# Altium project MD045B.PrjPcb (part 2 of 2)

## Sheet MD045B_POWER_AND_CONNECTORS.SchDoc: DRV8311HEVM
size 431 x 279 mm; Date: Not shown in title block; ApprovedBy: Not shown in title block; CheckedBy: Not shown in title block; Author: Not shown in title block; CompanyName: Not shown in title block; Engineer: Not shown in title block; Organization: Not shown in title block; Address1: Not shown in title block; Address2: Not shown in title block; Address3: Not shown in title block; Address4: Not shown in title block; DocumentNumber: 2; Revision: Use project parameter SCH_Rev; SheetNumber: 2; SheetTotal: 3; PageSetup: Record=PageOptions|CenterHorizontal=True|CenterVertical=True|PrintScale=1.00|XCorrection=1.00|YCorrection=1.00|PrintKind=0|BorderSize=5000000|LeftOffset=0|BottomOffset=0|Orientation=2|PaperLength=1000|PaperWidth=1000|Scale=100|PaperSource=15|PrintQuality=600|MediaType=1|DitherType=10|PaperKind=Letter|PrintScaleMode=1; CurrentTime: Not shown in title block; CurrentDate: Not shown in title block; Time: Not shown in title block; DocumentFullPathAndName: Not shown in title block; DocumentName: Not shown in title block; ModifiedDate: Not shown in title block; ImagePath: Not shown in title block
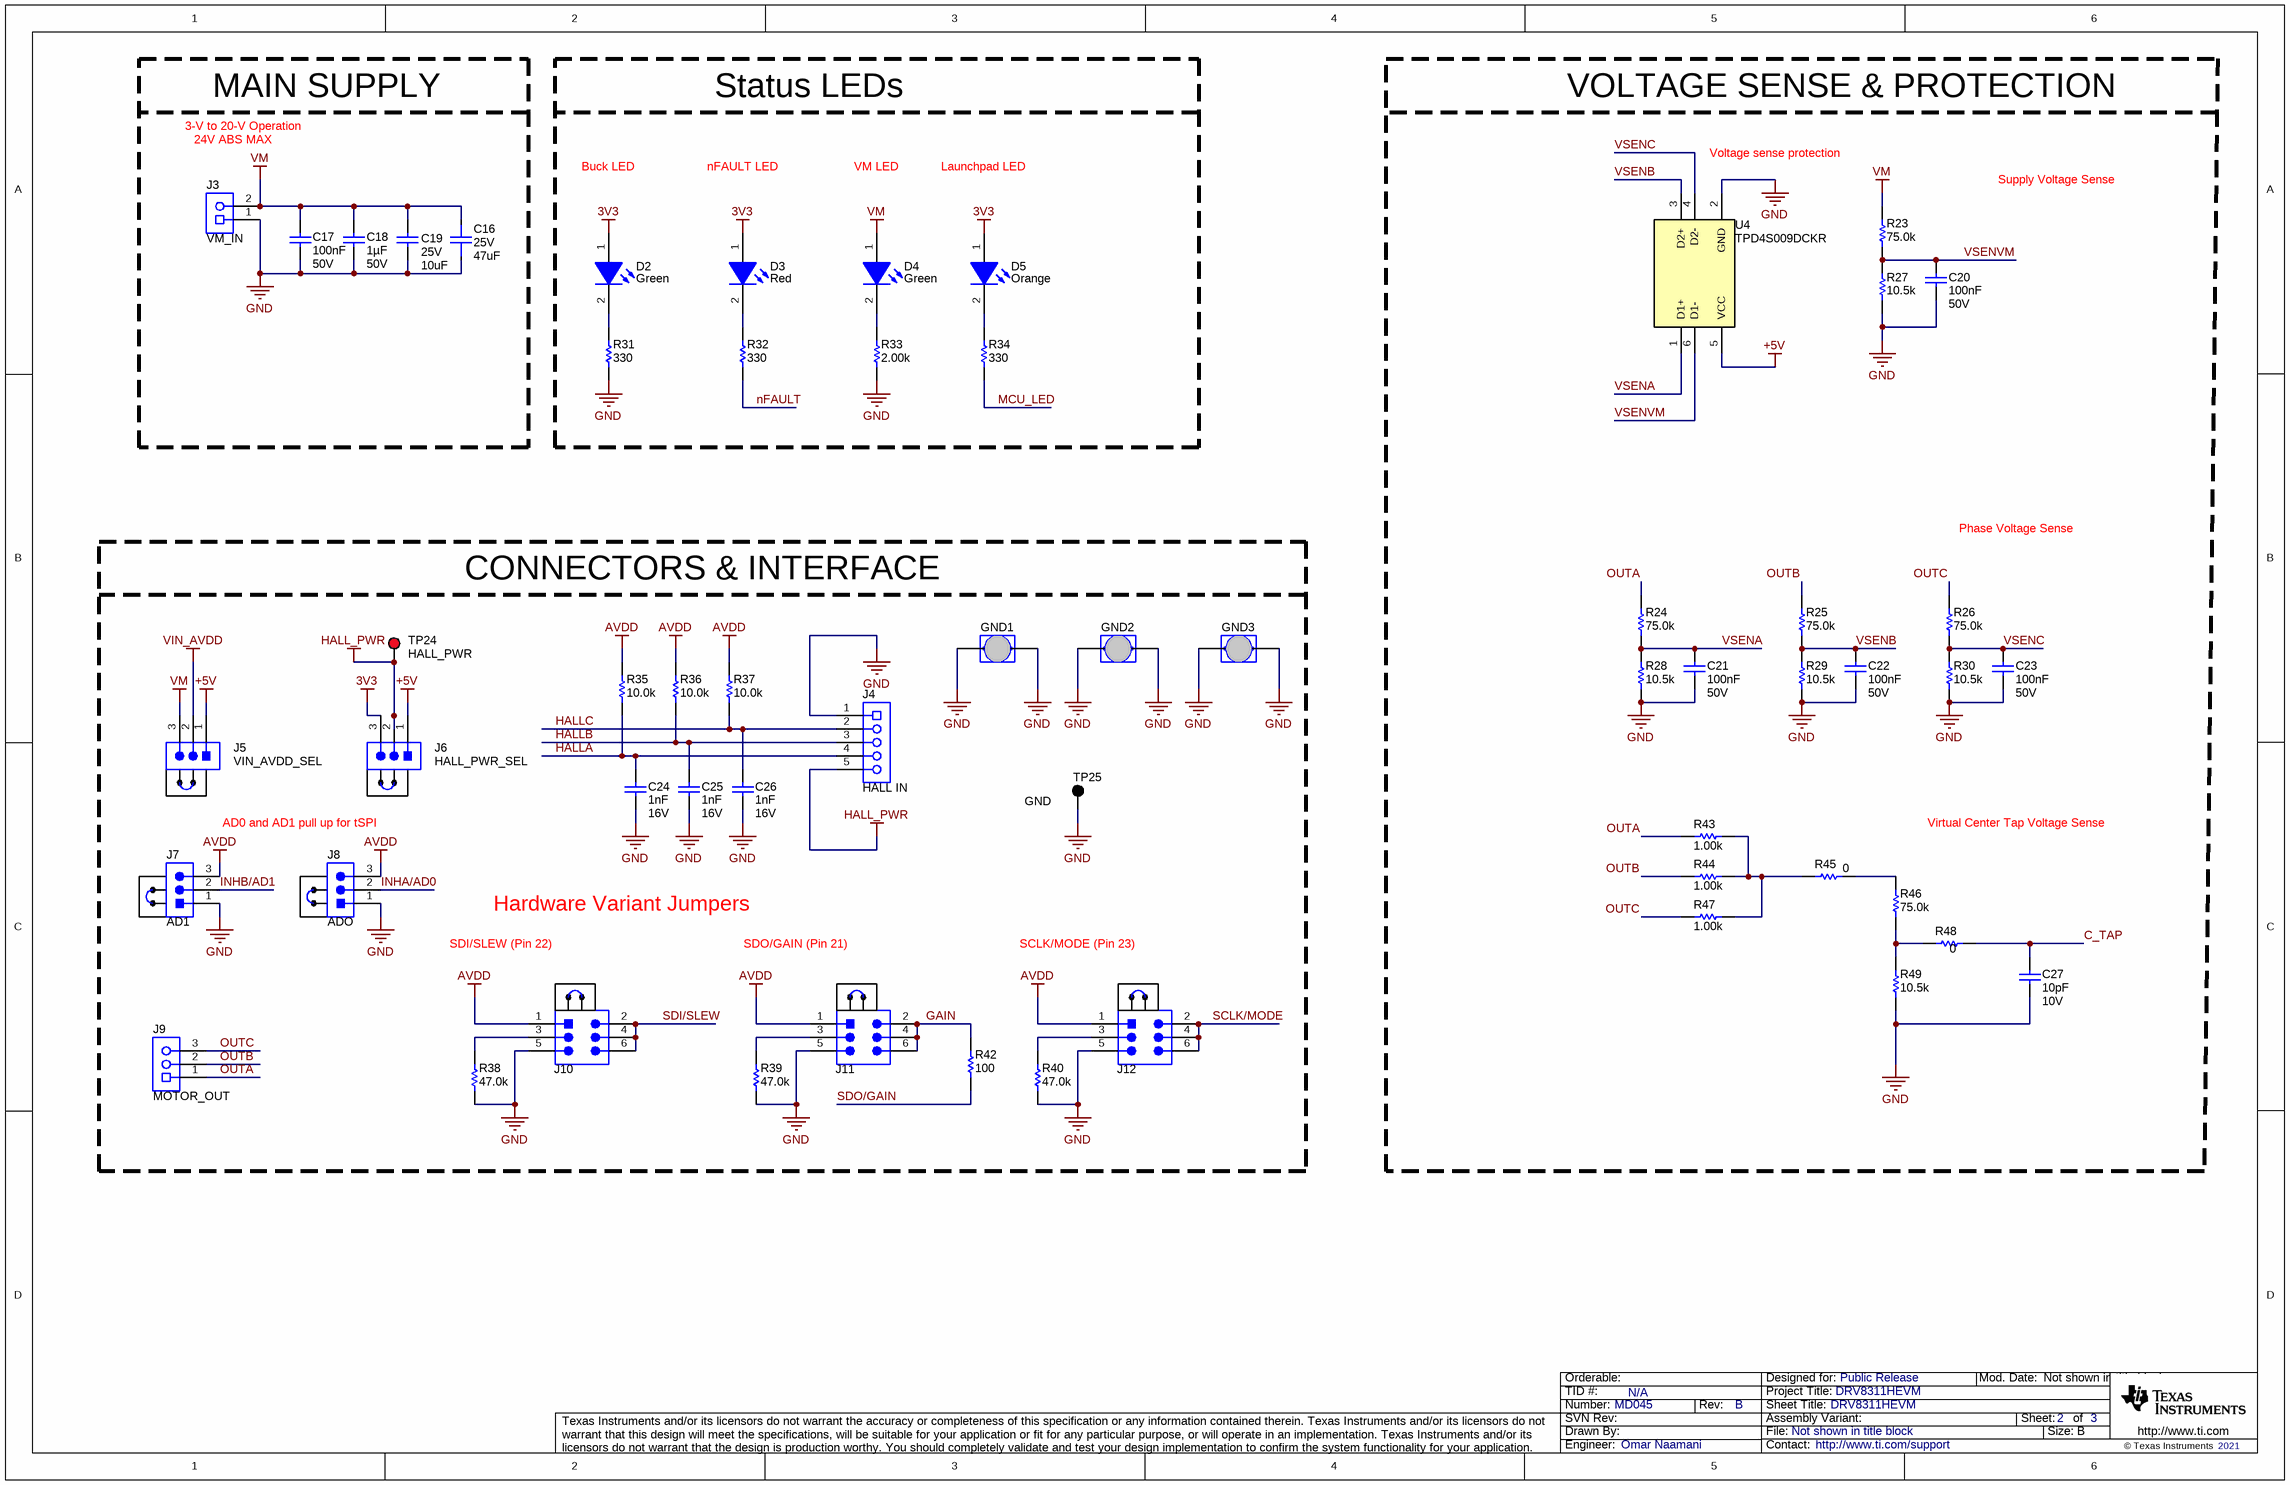
[diagram p2: MD045B_POWER_AND_CONNECTORS.SchDoc]

### Parts
C16  VDC_V: 25V  ValueDisplayed: 47uF  [FP-GRM31CR61E476ME44L_1206-MFG]  (hidden comment: GRM31CR61E476ME44L)
C17  Cap_F: 100nF  VDC_V: 50V  [0805L]  (hidden comment: C0805C104K5RACAUTO)
C18  Cap_F: 1µF  VDC_V: 50V  [0805L]  (hidden comment: 885012207103)
C19  VDC_V: 25V  ValueDisplayed: 10uF  [0805L]  (hidden comment: GRM21BC71E106KE11L)
C20  Cap_F: 100nF  VDC_V: 50V  [0603L]  (hidden comment: 06035C104JAT2A)
C21  Cap_F: 100nF  VDC_V: 50V  [0603L]  (hidden comment: 06035C104JAT2A)
C22  Cap_F: 100nF  VDC_V: 50V  [0603L]  (hidden comment: 06035C104JAT2A)
C23  Cap_F: 100nF  VDC_V: 50V  [0603L]  (hidden comment: 06035C104JAT2A)
C24  Cap_F: 1nF  VDC_V: 16V  [0603L]  (hidden comment: 885012206034)
C25  Cap_F: 1nF  VDC_V: 16V  [0603L]  (hidden comment: 885012206034)
C26  Cap_F: 1nF  VDC_V: 16V  [0603L]  (hidden comment: 885012206034)
C27  Cap_F: 10pF  VDC_V: 10V  [0603L]  (hidden comment: 0603ZC100KAT2A)
D2  value Green  [LTST-C170KGKT_Green]  (hidden comment: LTST-C170KGKT)
D3  value Red  [LED_LTST-C170_Red]  (hidden comment: LTST-C170KRKT)
D4  value Green  [LTST-C170KGKT_Green]  (hidden comment: LTST-C170KGKT)
D5  value Orange  [LTST-C170KFKT_Orange]  (hidden comment: LTST-C170KFKT)
GND1  GND  [Harwin_D3082-05]  (value not drawn)
GND2  GND  [Harwin_D3082-05]  (value not drawn)
GND3  GND  [Harwin_D3082-05]  (value not drawn)
J3  VM_IN  [On-Shore_ED120_2DS]
J4  HALL IN  [Phoenix_1792892]
J5  VIN_AVDD_SEL  [FCI_68001-403HLF]
J6  HALL_PWR_SEL  [FCI_68001-403HLF]
J7  AD1  [FCI_68001-403HLF]
J8  ADO  [FCI_68001-403HLF]
J9  MOTOR_OUT  [On-Shore_ED120_3DS]
J10  Header_3x2  [TSW-103-07-G-D]  (value not drawn)
J11  Header_3x2  [TSW-103-07-G-D]  (value not drawn)
J12  Header_3x2  [TSW-103-07-G-D]  (value not drawn)
R23  ValueDisplayed: 75.0k  [0603L]  (hidden comment: CRCW060375K0FKEA)
R24  ValueDisplayed: 75.0k  [0603L]  (hidden comment: CRCW060375K0FKEA)
R25  ValueDisplayed: 75.0k  [0603L]  (hidden comment: CRCW060375K0FKEA)
R26  ValueDisplayed: 75.0k  [0603L]  (hidden comment: CRCW060375K0FKEA)
R27  ValueDisplayed: 10.5k  [0603L]  (hidden comment: CRCW060310K5FKEA)
R28  ValueDisplayed: 10.5k  [0603L]  (hidden comment: CRCW060310K5FKEA)
R29  ValueDisplayed: 10.5k  [0603L]  (hidden comment: CRCW060310K5FKEA)
R30  ValueDisplayed: 10.5k  [0603L]  (hidden comment: CRCW060310K5FKEA)
R31  ValueDisplayed: 330  [0603L]  (hidden comment: RC0603FR-07330RL)
R32  ValueDisplayed: 330  [0603L]  (hidden comment: RC0603FR-07330RL)
R33  ValueDisplayed: 2.00k  [0603L]  (hidden comment: RG1608P-202-B-T5)
R34  ValueDisplayed: 330  [0603L]  (hidden comment: RC0603FR-07330RL)
R35  ValueDisplayed: 10.0k  [TNPW0603]  (hidden comment: TNPW060310K0BEEA)
R36  ValueDisplayed: 10.0k  [TNPW0603]  (hidden comment: TNPW060310K0BEEA)
R37  ValueDisplayed: 10.0k  [TNPW0603]  (hidden comment: TNPW060310K0BEEA)
R38  ValueDisplayed: 47.0k  [0603L]  (hidden comment: MCT0603MD4702DP500)
R39  ValueDisplayed: 47.0k  [0603L]  (hidden comment: MCT0603MD4702DP500)
R40  ValueDisplayed: 47.0k  [0603L]  (hidden comment: MCT0603MD4702DP500)
R42  ValueDisplayed: 100  [0603L]  (hidden comment: RT0603BRD07100RL)
R43  ValueDisplayed: 1.00k  [1206L]  (hidden comment: RP73D2B1K0BTG)
R44  ValueDisplayed: 1.00k  [1206L]  (hidden comment: RP73D2B1K0BTG)
R45  ValueDisplayed: 0  [0603L]  (hidden comment: ERJ-3GEY0R00V)
R46  ValueDisplayed: 75.0k  [0603L]  (hidden comment: CRCW060375K0FKEA)
R47  ValueDisplayed: 1.00k  [1206L]  (hidden comment: RP73D2B1K0BTG)
R48  ValueDisplayed: 0  [0603L]  (hidden comment: ERJ-3GEY0R00V)
R49  ValueDisplayed: 10.5k  [0603L]  (hidden comment: CRCW060310K5FKEA)
SH-J5  SNT-100-BK-G  [SNT-100-BK-G]  (value not drawn)
SH-J6  SNT-100-BK-G  [SNT-100-BK-G]  (value not drawn)
SH-J7  SNT-100-BK-G  [SNT-100-BK-G]  (value not drawn)
SH-J8  SNT-100-BK-G  [SNT-100-BK-G]  (value not drawn)
SH-J10  SNT-100-BK-G  [SNT-100-BK-G]  (value not drawn)
SH-J11  SNT-100-BK-G  [SNT-100-BK-G]  (value not drawn)
SH-J12  SNT-100-BK-G  [SNT-100-BK-G]  (value not drawn)
TP24  HALL_PWR  [Keystone5000]
TP25  GND  [Keystone5001]
U4  TPD4S009DCKR  [DCK0006A_N]

### Blocks framed on the sheet
MAIN SUPPLY: C16-C19 J3
Status LEDs: D2-D5 R31-R34
VOLTAGE SENSE & PROTECTION: C20-C23 C27 R23-R30 R43-R49 U4
CONNECTORS & INTERFACE: C24-C26 GND1-GND3 J4-J12 R35-R40 R42 SH-J5-SH-J8 SH-J10-SH-J12 TP24 TP25

### Nets
3V3: D2.1(A) D3.1(A) D5.1(A) J6.3
+5V: J5.1 J6.1 U4.5(VCC)
AVDD: J7.3 J8.3 J10.1 J11.1 J12.1 R35.2 R36.2 R37.2
GND: C16.1 C17.2 C18.2 C19.2 C20.2 C21.1 C22.2 C23.2 C24.2 C25.2 C26.2 C27.2 GND1.1 GND1.2 GND2.1 GND2.2 GND3.1 GND3.2 J3.1 J4.1 J7.1 J8.1 J10.5 J11.5 J12.5 R27.1 R28.1 R29.1 R30.1 R31.1 R33.1 R38.1 R39.1 R40.1 R49.1 TP25.1 U4.2(GND)
HALL_PWR: J4.5 J6.2 TP24.1
VIN_AVDD: J5.2
VM: C16.2 C17.1 C18.1 C19.1 D4.1(A) J3.2 J5.3 R23.2
C_TAP: C27.1 R48.2
GAIN: J11.2 J11.4 J11.6 R42.2
HALLA: C24.1 J4.4 R35.1
HALLB: C25.1 J4.3 R36.1
HALLC: C26.1 J4.2 R37.1
INHA/AD0: J8.2
INHB/AD1: J7.2
MCU_LED: R34.1
nFAULT: R32.1
OUTA: J9.1 R24.2 R43.1
OUTB: J9.2 R25.2 R44.1
OUTC: J9.3 R26.2 R47.1
SCLK/MODE: J12.2 J12.4 J12.6
SDI/SLEW: J10.2 J10.4 J10.6
SDO/GAIN: R42.1
VSENA: C21.2 R24.1 R28.2 U4.1(D1+)
VSENB: C22.1 R25.1 R29.2 U4.3(D2+)
VSENC: C23.1 R26.1 R30.2 U4.4(D2-)
VSENVM: C20.1 R23.1 R27.2 U4.6(D1-)
NetD2_2: D2.2(K) R31.2
NetD3_2: D3.2(K) R32.2
NetD4_2: D4.2(K) R33.2
NetD5_2: D5.2(K) R34.2
NetJ10_3: J10.3 R38.2
NetJ11_3: J11.3 R39.2
NetJ12_3: J12.3 R40.2
NetR43_2: R43.2 R44.2 R45.1 R47.2
NetR45_2: R45.2 R46.2
NetR46_1: R46.1 R48.1 R49.2

### Notes on the sheet
- 24V ABS MAX
- 3-V to 20-V Operation
- Buck LED
- nFAULT LED
- VM LED
- Launchpad LED
- Voltage sense protection
- Supply Voltage Sense
- Phase Voltage Sense
- AD0 and AD1 pull up for tSPI
- Virtual Center Tap Voltage Sense
- Hardware Variant Jumpers
- SDI/SLEW (Pin 22)
- SDO/GAIN (Pin 21)
- SCLK/MODE (Pin 23)
- Drawn By:
- SVN Rev:
- Number:
- TID #:
- Orderable:
- Rev:
- Sheet Title:
- File:
- Project Title:
- Designed for:
- Assembly Variant:
- Mod. Date:
- Sheet:
- Size:
- of
- B
- http://www.ti.com
- Texas Instruments and/or its licensors do not warrant the accuracy or completeness of this specification or any information contained therein. Texas Instruments and/or its licensors do not warrant that this design will meet the specifications, will be suitable for your application or fit for any particular purpose, or will operate in an implementation. Texas Instruments and/or its licensors do not warrant that the design is production worthy. You should completely validate and test your design implementation to confirm the system functionality for your application.
- Engineer:
- Contact:
- © Texas Instruments

### Library data of the parts
C16 = CMP-0090609-1: 47µF ±20% 25V Ceramic Capacitor X5R 1206 (3216 Metric); Manufacturer: Murata; TempCo: 15%; AEC Qualified: No; SizeZ_mm: 1.9mm; datasheet: https://www.murata.com/~/media/webrenewal/support/library/catalog/products/capacitor/mlcc/c02e.ashx; Value: 47µF; Tolerance_%: 20%; Digikey Part Number: 490-16268-1-ND; Lead Free: Yes; Part Number: GRM31CR61E476ME44L; Temperature Characteristic: X5R; ComponentLink1Description: Datasheet; Datasheet Path: datasheets/Cap-GRM31CR61E476ME44L.pdf; Digikey Description: CAP CER 47UF 25V X5R 1206; Operating Temperature Range: -55°C to +85°C; ComponentLink1URL: https://www.murata.com/~/media/webrenewal/support/library/catalog/products/capacitor/mlcc/c02e.ashx; Supplier 1: Digikey; Supplier 2: Mouser; PackageReference: 1206; helpURL: https://upverter.com/upn/revision/49488aee9021d1b4/; Supplier Part Number 2: 81-GRM31CR61E476ME4L; RoHS: TRUE; PartNumber: GRM31CR61E476ME44L; Mouser Part Number: 81-GRM31CR61E476ME4L; Supplier Part Number 1: 490-16268-1-ND; Cap_F: 47µF
C17 = CMP-0007725-2: CAP, CERM, 0.1 uF, 50 V, +/- 10%, X7R, AEC-Q200 Grade 0, 0805; Manufacturer: Kemet; TaMin_C: -55°C; Polarized: N; SizeAreaWB_mm2: 6.75; Value1: Unknown; U/M: EA; Value: 0.1uF; TaMax_C: 125°C; SizeZ_mm: 1.45; SizeX_mm: 2; SizeY_mm: 1.25; Cap_Case: 0805; SizeArea_mm2: 2.5; AEC Qualified: Y; AEC Grade: 0; AEC Category: Q200; Supplier Part Number 2: 86T2620; Publisher: Texas Instruments; Supplier 2: Newark; Supplier Part Number 3: 80-C0805C104K5RAUTO; TempCo: X7R; Supplier 3: Mouser; Published: 2008-06-19; RoHS: Y; MountType: SMT; Supplier 1: Digi-Key; PackageReference: 0805; Tolerance_%: 10%; Value2: 50V; CompType: Capacitor; LatestRevisionDate: 2017-03-09; PartNumber: C0805C104K5RACAUTO; ComponentLink1Description: Datasheet link; Supplier Part Number 1: 399-6928-1-ND; Technology: Ceramic; ValueDisplayed: 0.1uF; ComponentLink1URL: http://www.kemet.com/Lists/ProductCatalog/Attachments/53/KEM_C1002_X7R_SMD.pdf
C18 = CMP-0007696-2: CAP, CERM, 1 uF, 50 V, +/- 10%, X7R, 0805; Manufacturer: Wurth Elektronik; TaMin_C: -55°C; Polarized: N; SizeAreaWB_mm2: 6.75; Value1: Unknown; U/M: EA; Value: 1uF; TaMax_C: 125°C; SizeZ_mm: 1.45; SizeX_mm: 2; SizeY_mm: 1.25; Cap_Case: 0805; SizeArea_mm2: 2.5; AEC Category: Q200; Publisher: Texas Instruments; TempCo: X7R; Published: 2008-06-19; RoHS: Y; MountType: SMT; Supplier 1: Mouser; PackageReference: 0805; Tolerance_%: 10%; Value2: 50V; CompType: Capacitor; LatestRevisionDate: 2017-03-09; PartNumber: 885012207103; AEC Qualified: N; ComponentLink1Description: Datasheet link; AEC Grade: N/A; Supplier Part Number 1: 710-885012207103; Technology: Ceramic; ValueDisplayed: 1uF; ComponentLink1URL: http://katalog.we-online.de/pbs/datasheet/885012207103.pdf
C19 = CMP-0008262-2: CAP, CERM, 10 uF, 25 V, +/- 10%, X7S, 0805; Manufacturer: MuRata; TaMin_C: -55°C; Polarized: N; SizeAreaWB_mm2: 6.75; Value1: Unknown; U/M: EA; Value: 10uF; TaMax_C: 125°C; SizeZ_mm: 1.45; SizeX_mm: 2; SizeY_mm: 1.25; Cap_Case: 0805; SizeArea_mm2: 2.5; Cap_F: 10µF; AEC Category: Q200; Supplier Part Number 2: 81-GRM21BC71E106KE1L; Publisher: Texas Instruments; Supplier 2: Mouser; TempCo: X7S; Published: 2008-06-19; RoHS: Y; MountType: SMT; Supplier 1: Digi-Key; PackageReference: 0805; Tolerance_%: 10%; Value2: 25V; CompType: Capacitor; LatestRevisionDate: 2017-03-09; PartNumber: GRM21BC71E106KE11L; AEC Qualified: N; ComponentLink1Description: Datasheet link; AEC Grade: N/A; Supplier Part Number 1: 490-10496-1-ND; Technology: Ceramic; ComponentLink1URL: http://psearch.en.murata.com/capacitor/product/GRM21BC71E106KE11%23.pdf
C20-C23 = CMP-0083854-1: CAP, CERM, 0.1 µF, 50 V,+/- 5%, X7R, 0603; Manufacturer: AVX; TaMin_C: -55°C; Polarized: N; Green_Lifecycle: Active; SizeAreaWB_mm2: 4.68; Green_REACh: Passed; U/M: EA; Value: 0.1uF; TaMax_C: 125°C; SizeZ_mm: 1; SizeX_mm: 1.6; SizeY_mm: 0.8; Cap_Case: 0603; SizeArea_mm2: 1.28; AEC Category: Q200; ValueDisplayed: 0.1µF; ComponentLink1URL: http://datasheets.avx.com/X7RDielectric.pdf; TempCo: X7R; RoHS: Y; MountType: SMT; Green_EU RoHS-2: Passed; Green_EU RoHS: Passed; PackageReference: 0603; Tolerance_%: 5%; Value2: 50V; CompType: Capacitor; PartNumber: 06035C104JAT2A; AEC Qualified: N; ComponentLink1Description: Datasheet link; AEC Grade: N/A; Technology: Ceramic
C24-C26 = CMP-0006826-4: CAP, CERM, 1000 pF, 16 V, +/- 10%, X7R, 0603; Manufacturer: Wurth Elektronik; TaMin_C: -55°C; Polarized: N; SizeAreaWB_mm2: 4.68; Value1: Unknown; U/M: EA; Value: 1000pF; TaMax_C: 125°C; SizeZ_mm: 1; SizeX_mm: 1.6; SizeY_mm: 0.8; Cap_Case: 0603; SizeArea_mm2: 1.28; AEC Category: Q200; Publisher: Texas Instruments; TempCo: X7R; Published: 2008-06-19; RoHS: Y; MountType: SMT; Supplier 1: Mouser; PackageReference: 0603; Tolerance_%: 10%; Value2: 16V; CompType: Capacitor; LatestRevisionDate: 2017-03-09; PartNumber: 885012206034; AEC Qualified: N; ComponentLink1Description: Datasheet link; AEC Grade: N/A; Supplier Part Number 1: 710-885012206034; Technology: Ceramic; ValueDisplayed: 1000pF; ComponentLink1URL: http://katalog.we-online.de/pbs/datasheet/885012206034.pdf
C27 = CMP-0006811-4: CAP, CERM, 10 pF, 10 V, +/- 10%, X7R, 0603; Manufacturer: AVX; TaMin_C: -55°C; Polarized: N; SizeAreaWB_mm2: 4.68; Value1: Unknown; U/M: EA; Value: 10pF; TaMax_C: 125°C; SizeZ_mm: 1; SizeX_mm: 1.6; SizeY_mm: 0.8; Cap_Case: 0603; SizeArea_mm2: 1.28; AEC Category: Q200; Supplier Part Number 2: 66M2930; Publisher: Texas Instruments; Supplier 2: Newark; Supplier Part Number 3: 581-0603ZC100KAT2A; TempCo: X7R; Supplier 3: Mouser; Published: 2008-06-19; RoHS: Y; MountType: SMT; Supplier 1: Digi-Key; PackageReference: 0603; Tolerance_%: 10%; Value2: 10V; CompType: Capacitor; LatestRevisionDate: 2017-03-09; PartNumber: 0603ZC100KAT2A; AEC Qualified: N; ComponentLink1Description: Datasheet link; AEC Grade: N/A; Supplier Part Number 1: 0603ZC100KAT2A-ND; Technology: Ceramic; ValueDisplayed: 10pF; ComponentLink1URL: http://datasheets.avx.com/X7RDielectric.pdf
D2 D4 = CMP-0002888-2: LED, Green, SMD; Manufacturer: Lite-On; Io_A: 20mA; Value1: W; Vf_V: 2V; Type: AlInGaP; ComponentLink1URL: http://optoelectronics.liteon.com/upload/download/DS22-2000-073/S_110_LTST-C170KGKT.pdf; Color: Green; RoHS: Y; MountType: SMT; PackageReference: LED_0805; Value2: 2V; CompType: LED; PartNumber: LTST-C170KGKT; ComponentLink1Description: Datasheet link
D3 = CMP-0002829-3: LED, Red, SMD; Manufacturer: Lite-On; Io_A: 20mA; SizeAreaWB_mm2: 6.75; Value1: W; SizeZ_mm: 1.2; SizeX_mm: 2; SizeY_mm: 1.25; Vf_V: 2V; SizeArea_mm2: 2.5; Type: AlInGaP; ComponentLink1URL: http://optoelectronics.liteon.com/upload/download/DS-22-99-0150/P_100_LTST-C170KRKT.pdf; Color: red; RoHS: Y; MountType: SMT; PackageReference: Red 0805 LED; Value2: 2V; CompType: LED; PartNumber: LTST-C170KRKT; ComponentLink1Description: Datasheet link
D5 = CMP-0002890-1: LED, Orange, SMD; Manufacturer: Lite-On; Io_A: 20mA; Value1: W; U/M: EA; Vf_V: 2V; Type: AlInGaP; ComponentLink1URL: http://optoelectronics.liteon.com/upload/download/DS-22-99-0185/S_110_LTST-C170KFKT.pdf; Publisher: Texas Instruments; Color: orange; Published: 2008-07-11; RoHS: Y; MountType: SMT; Supplier 1: Digi-Key; PackageReference: LED_0805; Value2: 2V; CompType: LED; LatestRevisionDate: 2017-03-09; PartNumber: LTST-C170KFKT; ComponentLink1Description: Datasheet link; Supplier Part Number 1: 160-1413-1-ND
GND1-GND3 = CMP-0075110-1: 1mm Uninsulated Shorting Plug, 10.16mm spacing, TH; Manufacturer: Harwin; PartNumber: D3082-05; CNHeader: False; Green_Lifecycle: Active; Green_REACh: Passed; CompType: Jumper Wire; ComponentLink1URL: http://cdn.harwin.com/pdfs/D3080-D3083.pdf; Supplier Part Number 2: 01E9240; Publisher: Texas Instruments; Supplier 2: Newark; Supplier Part Number 3: 855-D3082-05; Supplier 3: Mouser; RoHS: Y; MountType: TH; Green_EU RoHS-2: Passed; Supplier 1: Digi-Key; Green_EU RoHS: Passed with Exemption; PackageReference: Shorting Plug, 10.16mm spacing, TH; LatestRevisionDate: 2017-07-12; ComponentLink1Description: Datasheet URL; Supplier Part Number 1: 952-1873-ND; CT: False
J3 = CMP-0074910-1: Terminal Block, 5.08 mm, 2x1, Brass, TH; Manufacturer: On-Shore Technology; PartNumber: ED120/2DS; Cert_VDE: Y; CNHeader: False; Current_A: 15A; Green_Lifecycle: Not Set; Shrouded: N; Gender: Female; Green_REACh: Incomplete; Voltage_V: 300V; Row_Count: 1; Pitch_mm: 5.08; CT: True; ComponentLink1URL: http://www.on-shore.com/sites/default/files/manuals/ed120ds.pdf; Publisher: Texas Instruments; Color: Blue; Cert_CULUS: Y; RoHS: Y; MountType: TH; Green_EU RoHS-2: Incomplete; Supplier 1: Digi-Key; Green_EU RoHS: Incomplete; PackageReference: 2x1 5.08 mm Terminal Block; PinCount: 2; CompType: Terminal Block; LatestRevisionDate: 2017-07-12; Orientation: Vertical; ComponentLink1Description: Datasheet URL; Supplier Part Number 1: ED1609-ND; ContactFinish: Brass
J4 = CMP-0055532-1: Terminal Block, 5mm, 5x1, R/A, TH; Manufacturer: Phoenix Contact; PartNumber: 1792892; Cert_VDE: Y; CNHeader: FALSE; Current_A: 16A; Gender: Female; Voltage_V: 400V; Row_Count: 1; Pitch_mm: 5; CT: TRUE; ComponentLink1URL: https://www.phoenixcontact.com/online/portal/pi?uri=pxc-oc-itemdetail:pid=1792892&library=pien&pcck=P-11-01-05&tab=1; Supplier Part Number 2: 78T0423; Publisher: Texas Instruments; Supplier 2: Newark; Supplier Part Number 3: 651-1792892; Color: Green; Supplier 3: Mouser; Cert_CULUS: Y; RoHS: Y; MountType: TH; Supplier 1: Digi-Key; PackageReference: Terminal Block, 5mm, 5x1, R/A, TH; PinCount: 5; CompType: Terminal Block; LatestRevisionDate: 26/05/2017; Orientation: R/A; ComponentLink1Description: Datasheet URL; Supplier Part Number 1: 277-2521-ND; Cert_UL: Y
J5-J8 = CMP-0065026-1: Header, 2.54mm, 3x1, Tin, TH; Manufacturer: FCI; PartNumber: 68001-403HLF; CNHeader: True; Current_A: 3A; Shrouded: N; Gender: Male; Cert_CSA: Y; Voltage_V: 1.5kV; Row_Count: 1; Pitch_mm: 2.54; CT: False; ComponentLink1URL: http://portal.fciconnect.com/Comergent//fci/drawing/68000.pdf; ClassName: Header; Supplier Part Number 2: 44P3034; Publisher: Texas Instruments; Supplier 2: Newark; Supplier Part Number 3: 649-68001-403HLF; Color: Black; Supplier 3: Mouser; RoHS: Y; MountType: TH; Supplier 1: Digi-Key; PackageReference: Header, 2.54mm, 3x1, TH; PinCount: 3; CompType: Header; LatestRevisionDate: 2017-06-05; Orientation: Vertical; ComponentLink1Description: Datasheet URL; Supplier Part Number 1: 609-3471-ND; ContactFinish: Tin; Cert_UL: Y
J9 = CMP-0074911-1: Terminal Block, 5.08 mm, 3x1, Brass, TH; Manufacturer: On-Shore Technology; PartNumber: ED120/3DS; Cert_VDE: Y; CNHeader: False; Current_A: 15A; Green_Lifecycle: Not Set; Shrouded: N; Gender: Female; Green_REACh: Incomplete; Voltage_V: 300V; Row_Count: 1; Pitch_mm: 5.08; CT: True; ComponentLink1URL: http://www.on-shore.com/sites/default/files/manuals/ed120ds.pdf; Publisher: Texas Instruments; Color: Blue; Cert_CULUS: Y; RoHS: Y; MountType: TH; Green_EU RoHS-2: Incomplete; Supplier 1: Digi-Key; Green_EU RoHS: Incomplete; PackageReference: 3x1 5.08 mm Terminal Block; PinCount: 3; CompType: Terminal Block; LatestRevisionDate: 2017-07-12; Orientation: Vertical; ComponentLink1Description: Datasheet URL; Supplier Part Number 1: ED1610-ND; ContactFinish: Brass
J10-J12 = CMP-0075406-2: Header, 100mil, 3x2, Gold, TH; Manufacturer: Samtec; Pitch_mm: 2.54; Gender: Male; Shrouded: N; Row_Count: 2; Current_A: 6.3A; Voltage_V: 550V; Cert_CSA: Y; Green_Lifecycle: Active; Green_REACh: Passed; PartNumber: TSW-103-07-G-D; PackageReference: 3x2 Header; ClassName: Header; CompType: Header; RoHS: Y; MountType: TH; ComponentLink1Description: Datasheet URL; ComponentLink1URL: http://samtec.com/ftppub/pdf/TSW_TH.PDF; Orientation: Vertical; PinCount: 6; RowSpacing_mm: 2.54; ContactFinish: Gold; Color: Black; Cert_UL: Y; Cert_CULUS: N; Cert_VDE: N; Supplier 1: Digi-Key; Supplier Part Number 1: SAM1028-03-ND; Green_EU RoHS: Passed; Green_EU RoHS-2: Passed
R23-R26 R46 = CMP-0022589-4: RES, 75.0 k, 1%, 0.1 W, AEC-Q200 Grade 0, 0603; Manufacturer: Vishay-Dale; Power_W: 100mW; TempCo: 100 ppm/C; Value_Code: 75k0; Value: 75.0k; EIA_Code: E96; Res_ohm: 75k; SizeX_mm: 1.6; SizeY_mm: 0.8; SizeZ_mm: 1; Value2: 0.1W; SizeArea_mm2: 1.28; AEC Qualified: Y; VDC_V: 75V; AEC Category: Q200; AEC Grade: 0; Supplier Part Number 2: 52K8708; Supplier 2: Newark; Supplier Part Number 3: 71-CRCW0603-75K-E3; Supplier 3: Mouser; RoHS: E; Value1: 1%; MountType: SMT; Supplier 1: Digi-Key; PackageReference: 0603; Tolerance_%: 1%; CompType: Resistor; PartNumber: CRCW060375K0FKEA; ComponentLink1Description: Datasheet link; Supplier Part Number 1: 541-75.0KHCT-ND; Technology: Thick Film; ComponentLink1URL: http://www.vishay.com/docs/20035/dcrcwe3.pdf
R27-R30 R49 = CMP-0022000-4: RES, 10.5 k, 1%, 0.1 W, AEC-Q200 Grade 0, 0603; Manufacturer: Vishay-Dale; Power_W: 100mW; TempCo: 100 ppm/C; Value_Code: 10k5; Value: 10.5k; EIA_Code: E96; SizeX_mm: 1.6; SizeY_mm: 0.8; SizeZ_mm: 1; Value2: 0.1W; SizeArea_mm2: 1.28; AEC Qualified: Y; VDC_V: 75V; AEC Category: Q200; AEC Grade: 0; Supplier Part Number 2: 52K8068; Supplier 2: Newark; Supplier Part Number 3: 71-CRCW0603-10.5K-E3; Supplier 3: Mouser; RoHS: E; Value1: 1%; MountType: SMT; Supplier 1: Digi-Key; PackageReference: 0603; Tolerance_%: 1%; Res_ohm: 10.5k; CompType: Resistor; PartNumber: CRCW060310K5FKEA; ComponentLink1Description: Datasheet link; Supplier Part Number 1: 541-10.5KHCT-ND; Technology: Thick Film; ComponentLink1URL: http://www.vishay.com/docs/20035/dcrcwe3.pdf
R31 R32 R34 = CMP-0023033-5: RES, 330, 1%, 0.1 W, 0603; Manufacturer: Yageo; Power_W: 100mW; TempCo: 100 ppm/C; Value_Code: 330R; Value: 330; SizeX_mm: 1.6; SizeY_mm: 0.8; SizeZ_mm: 1; Value2: 0.1W; SizeArea_mm2: 1.28; AEC Qualified: N; VDC_V: 75V; AEC Category: Q200; SizeAreaWB_mm2: 4.68; Supplier Part Number 2: 603-RC0603FR-07330RL; Supplier 2: Mouser; Supplier Part Number 3: 9238425; Supplier 3: Farnell; RoHS: Y; Value1: 1%; MountType: SMT; Supplier 1: Digi-Key; PackageReference: 0603; Tolerance_%: 1%; Res_ohm: 330; CompType: Resistor; PartNumber: RC0603FR-07330RL; ComponentLink1Description: Datasheet link; Supplier Part Number 1: 311-330HRCT-ND; Technology: Thick Film; ComponentLink1URL: http://www.yageo.com/pdf/Pu-RC0603_51_PbFree_L_2.pdf; AEC Grade: N/A
R33 = CMP-0023463-3: RES, 2.00 k, 0.1%, 0.1 W, 0603; Manufacturer: Susumu Co Ltd; Power_W: 100mW; TempCo: 25 ppm/C; Value_Code: 2k00; U/M: EA; Value: 2.00k; EIA_Code: E192; Res_ohm: 2k; SizeX_mm: 1.6; SizeY_mm: 0.8; SizeZ_mm: 1; Value2: 0.1W; SizeArea_mm2: 1.28; VDC_V: 75V; AEC Category: Q200; Supplier Part Number 2: 754-RG1608P-202-B-T5; Publisher: Texas Instruments; Supplier 2: Mouser; Supplier Part Number 3: 1796946; Supplier 3: Farnell; Published: 2008-06-26; RoHS: Y; Value1: 0.1%; MountType: SMT; Supplier 1: Digi-Key; PackageReference: 0603; Tolerance_%: 0.1%; CompType: Resistor; LatestRevisionDate: 2017-03-09; PartNumber: RG1608P-202-B-T5; AEC Qualified: ?; ComponentLink1Description: Datasheet link; Supplier Part Number 1: RG16P2.0KBCT-ND; Technology: Metal Film; ComponentLink1URL: http://www.susumu.co.jp/english/pdf/products-j01-01.pdf
R35-R37 = CMP-0025686-1: RES, 10.0 k, 0.1%, 0.1 W, AEC-Q200 Grade 1, 0603; Manufacturer: Vishay-Dale; Power_W: 100mW; TempCo: 25 ppm/C; Value_Code: 10k0; U/M: EA; Value: 10.0k; EIA_Code: E192; Res_ohm: 10k; SizeX_mm: 1.6; SizeY_mm: 0.85; SizeZ_mm: 0.55; Value2: 0.1W; SizeArea_mm2: 1.36; AEC Qualified: Y; VDC_V: 75V; AEC Grade: 1; AEC Category: Q200; ComponentLink1URL: http://www.vishay.com/docs/28758/tnpw_e3.pdf; Supplier Part Number 2: 26R4218; Publisher: Texas Instruments; Supplier 2: Newark; Supplier Part Number 3: 71-TNPW060310K0BEEA; Supplier 3: Mouser; Published: 2008-06-26; RoHS: Y; Value1: 0.1%; MountType: SMT; Supplier 1: Digi-Key; PackageReference: 0603; Tolerance_%: 0.1%; CompType: Resistor; LatestRevisionDate: 2017-03-09; PartNumber: TNPW060310K0BEEA; ComponentLink1Description: Datasheet link; Supplier Part Number 1: TNP10.0KAACT-ND; Technology: Thin Film
R38-R40 = CMP-0086186-1: RES, 47.0 k, 0.5%, 0.15 W, AEC-Q200 Grade 0, 0603; Manufacturer: Vishay/Beyschlag; Power_W: 150mW; SizeArea_mm2: 1.28; Res_ohm: 47k; SizeX_mm: 1.6; Value2: 0.15W; AEC Category: Q200; TempCo: 25 ppm/C; SizeAreaWB_mm2: 4.68; SizeY_mm: 0.8; AEC Grade: 0; AEC Qualified: Y; Value_Code: 47k0; SizeZ_mm: 1; Value: 47.0k; Value1: 0.5%; Technology: Thin Film; ComponentLink1Description: Datasheet link; PackageReference: 0603; CompType: Resistor; RoHS: Y; PartNumber: MCT0603MD4702DP500; MountType: SMT; ComponentLink1URL: http://www.vishay.com/docs/28760/mcat_pro.pdf; Tolerance_%: 0.5%
R42 = CMP-0023631-3: RES, 100, 0.1%, 0.1 W, 0603; Manufacturer: Yageo America; Power_W: 100mW; TempCo: 25 ppm/C; Value_Code: 100R; U/M: EA; Value: 100; EIA_Code: E192; SizeX_mm: 1.6; SizeY_mm: 0.8; SizeZ_mm: 1; Value2: 0.1W; SizeArea_mm2: 1.28; VDC_V: 75V; AEC Category: Q200; Publisher: Texas Instruments; Published: 2008-06-26; RoHS: Y; Value1: 0.1%; MountType: SMT; PackageReference: 0603; Tolerance_%: 0.1%; Res_ohm: 100; CompType: Resistor; LatestRevisionDate: 2017-03-09; PartNumber: RT0603BRD07100RL; AEC Qualified: ?; ComponentLink1Description: Datasheet link; Technology: Thin Film; ComponentLink1URL: http://www.yageo.com/pdf/PYu-RT_1-to-0.05_RoHS_L_3.pdf
R43 R44 R47 = CMP-0018797-1: RES, 1.00 k, 0.1%, 0.25 W, 1206; Manufacturer: TE Connectivity; Power_W: 250mW; TempCo: 15 ppm/C; Value_Code: 1k00; U/M: EA; Value: 1.00k; EIA_Code: E192; Res_ohm: 1k; SizeX_mm: 3.2; SizeY_mm: 1.6; SizeZ_mm: 1.35; Value2: 0.25W; SizeArea_mm2: 5.12; AEC Qualified: N; VDC_V: 200V; AEC Category: Q200; ComponentLink1URL: http://www.te.com/commerce/DocumentDelivery/DDEController?Action=srchrtrv&DocNm=1773272&DocType=DS&DocLang=English; Supplier Part Number 2: 51R8320; Publisher: Texas Instruments; Supplier 2: Newark; Supplier Part Number 3: 279-RP73D2B1K0BTG; Supplier 3: Mouser; Published: 2008-06-26; RoHS: Y; Value1: 0.1%; MountType: SMT; Supplier 1: Digi-Key; PackageReference: 1206; Tolerance_%: 0.1%; CompType: Resistor; LatestRevisionDate: 2017-03-09; PartNumber: RP73D2B1K0BTG; ComponentLink1Description: Datasheet link; AEC Grade: N/A; Supplier Part Number 1: A105676-ND; Technology: Thin Film
R45 R48 = CMP-0025874-4: RES, 0, 5%, 0.1 W, AEC-Q200 Grade 0, 0603; Manufacturer: Panasonic; Power_W: 100mW; TempCo: 600 ppm/C; Value_Code: 0000; Value: 0; EIA_Code: E24; SizeX_mm: 1.6; SizeY_mm: 0.8; SizeZ_mm: 1; Value2: 0.1W; SizeArea_mm2: 1.28; AEC Qualified: Y; VDC_V: 50V; AEC Category: Q200; SizeAreaWB_mm2: 4.68; Supplier Part Number 2: 667-ERJ-3GEY0R00V; Supplier 2: Mouser; Supplier Part Number 3: 2059527; Supplier 3: Farnell; RoHS: Y; Value1: 5%; MountType: SMT; Supplier 1: Digi-Key; PackageReference: 0603; Tolerance_%: 5%; Res_ohm: 0; CompType: Resistor; PartNumber: ERJ-3GEY0R00V; ComponentLink1Description: Datasheet link; Supplier Part Number 1: P0.0GCT-ND; Technology: Thick Film; ComponentLink1URL: https://industrial.panasonic.com/cdbs/www-data/pdf/RDA0000/AOA0000C301.pdf; AEC Grade: 0
SH-J5-SH-J8 SH-J10-SH-J12 = CMP-0003623-3: Shunt, 100mil, Gold plated, Black; Alternate PartNumber: 969102-0000-DA; Manufacturer: Samtec; Alternate Manufacturer: 3M; Value: 1x2; ComponentLink1URL: http://www.samtec.com/ftppub/pdf/SNT.PDF; Supplier 1: Digi-Key; CompType: Shunt; PackageReference: Shunt; ClassName: Shunt; RoHS: Y; Supplier Part Number 1: SAM8858-ND; MountType: N/A; PartNumber: SNT-100-BK-G; ComponentLink1Description: Datasheet Link
TP24 = CMP-0055137-1: Test Point, Miniature, Red, TH; PartNumber: 5000; Manufacturer: Keystone; ContactFinish: Silver; CNHeader: FALSE; CT: TRUE; Green_Lifecycle: Active; Green_REACh: Passed; PackageReference: Red Miniature Testpoint; CompType: Test Point; RoHS: Y; MountType: TH; ComponentLink1Description: Datasheet URL; ComponentLink1URL: http://www.keyelco.com/userAssets/file/M60-2p60.pdf; Publisher: Texas Instruments; LatestRevisionDate: 26/05/2017; Supplier 1: Digi-Key; Supplier Part Number 1: 36-5000-ND; Supplier 2: Mouser; Supplier Part Number 2: 534-5000; Color: Red; Green_EU RoHS-2: Incomplete; Green_EU RoHS: Passed
TP25 = CMP-0055138-1: Test Point, Miniature, Black, TH; Manufacturer: Keystone; CNHeader: FALSE; Green_Lifecycle: Active; Green_REACh: Passed; ContactFinish: Silver; CT: TRUE; ComponentLink1URL: http://www.keyelco.com/userAssets/file/M60-2p60.pdf; Supplier Part Number 2: 534-5001; Publisher: Texas Instruments; Supplier 2: Mouser; Color: Black; RoHS: Y; MountType: TH; Green_EU RoHS-2: Incomplete; Supplier 1: Digi-Key; Green_EU RoHS: Passed; PackageReference: Black Miniature Testpoint; CompType: Test Point; LatestRevisionDate: 26/05/2017; PartNumber: 5001; ComponentLink1Description: Datasheet URL; Supplier Part Number 1: 36-5001-ND
U4 = CMP-0043118-3: 4-Channel ESD Solution for High-Speed Differential Interface, DCK0006A (SOT-SC70-6); Manufacturer: Texas Instruments; IO Leakage Current(nA): 10; IO Capacitance(Typ)(pF): 0.8; Eco-Plan: Green (RoHS & no Sb/Br); Breakdown Voltage(Min)(V): 9; Differential Capacitance(pF): 0.05; AEC Category: Q200; AEC Qualified: N; CompType: IC; Rating: Catalog; SizeAreaWB_mm2: 9.3; SizeArea_mm2: 4.2; SizeX_mm: 2.1; SizeY_mm: 2.0; SizeZ_mm: 1.1; ComponentLink1URL: http://www.ti.com/lit/ds/symlink/tpd4s009.pdf; PackageDescription: SOT-SC70-6; ComponentLink2URL: http://www.ti.com/product/tpd4s009; ComponentLink3Description: Online Datasheet; ComponentLink2Description: Product Folder; ComponentLink3URL: http://www.ti.com/product/tpd4s009/datasheet; PackageReference: DCK0006A; PartNumber: TPD4S009DCKR; ComponentLink1Description: Datasheet Link; MountType: SMT; Operating Temperature Range: -40 to 85 C; RoHS: Y

## Nets that join several sheets
3V3: MD045B_DRIVER (6 pins), MD045B_POWER_AND_CONNECTORS (D2.1 D3.1 D5.1 J6.3)
+5V: MD045B_DRIVER (R15.2 TP23.1), MD045B_POWER_AND_CONNECTORS (J5.1 J6.1 U4.5)
AVDD: MD045B_DRIVER (C2.1 R6.1 TP12.1 U1.17), MD045B_POWER_AND_CONNECTORS (8 pins)
GND: MD045B_DRIVER (22 pins), MD045B_POWER_AND_CONNECTORS (37 pins)
VIN_AVDD: MD045B_DRIVER (TP8.1 U1.7), MD045B_POWER_AND_CONNECTORS (J5.2)
VM: MD045B_DRIVER (10 pins), MD045B_POWER_AND_CONNECTORS (8 pins)
C_TAP: MD045B_DRIVER (J1.20), MD045B_POWER_AND_CONNECTORS (C27.1 R48.2)
HALLA: MD045B_DRIVER (J2.13), MD045B_POWER_AND_CONNECTORS (C24.1 J4.4 R35.1)
HALLB: MD045B_DRIVER (J2.15), MD045B_POWER_AND_CONNECTORS (C25.1 J4.3 R36.1)
HALLC: MD045B_DRIVER (J1.7), MD045B_POWER_AND_CONNECTORS (C26.1 J4.2 R37.1)
INHA/AD0: MD045B_DRIVER (J2.1 TP6.1 U1.15), MD045B_POWER_AND_CONNECTORS (J8.2)
INHB/AD1: MD045B_DRIVER (J2.5 TP20.1 U1.14), MD045B_POWER_AND_CONNECTORS (J7.2)
MCU_LED: MD045B_DRIVER (J2.20), MD045B_POWER_AND_CONNECTORS (R34.1)
nFAULT: MD045B_DRIVER (R6.2 R18.1 R20.1 U1.1), MD045B_POWER_AND_CONNECTORS (R32.1)
OUTA: MD045B_DRIVER (TP2.1 U1.10), MD045B_POWER_AND_CONNECTORS (J9.1 R24.2 R43.1)
OUTB: MD045B_DRIVER (TP9.1 U1.11), MD045B_POWER_AND_CONNECTORS (J9.2 R25.2 R44.1)
OUTC: MD045B_DRIVER (TP16.1 U1.12), MD045B_POWER_AND_CONNECTORS (J9.3 R26.2 R47.1)
SCLK/MODE: MD045B_DRIVER (R8.2 TP4.1 U1.23), MD045B_POWER_AND_CONNECTORS (J12.2 J12.4 J12.6)
SDI/SLEW: MD045B_DRIVER (R9.2 TP11.1 U1.22), MD045B_POWER_AND_CONNECTORS (J10.2 J10.4 J10.6)
SDO/GAIN: MD045B_DRIVER (R10.2 R13.2 TP18.1 U1.21), MD045B_POWER_AND_CONNECTORS (R42.1)
VSENA: MD045B_DRIVER (J1.6), MD045B_POWER_AND_CONNECTORS (C21.2 R24.1 R28.2 U4.1)
VSENB: MD045B_DRIVER (J1.8), MD045B_POWER_AND_CONNECTORS (C22.1 R25.1 R29.2 U4.3)
VSENC: MD045B_DRIVER (J1.10), MD045B_POWER_AND_CONNECTORS (C23.1 R26.1 R30.2 U4.4)
VSENVM: MD045B_DRIVER (J1.12), MD045B_POWER_AND_CONNECTORS (C20.1 R23.1 R27.2 U4.6)

## Assembly variants
001: not fitted C27 FID1 FID2 FID3 R12 R14 R17 R18 R21 R41 SH-J7 SH-J8 SH-J10 SH-J11 SH-J12
002: not fitted C27 FID1 FID2 FID3 R8 R9 R10 R11 R13 R14 R17 R18 R21 R41 SH-J7 SH-J8
003: not fitted C27 FID1 FID2 FID3 R1 R11 R14 R17 R18 R21 SH-J10 SH-J11 SH-J12